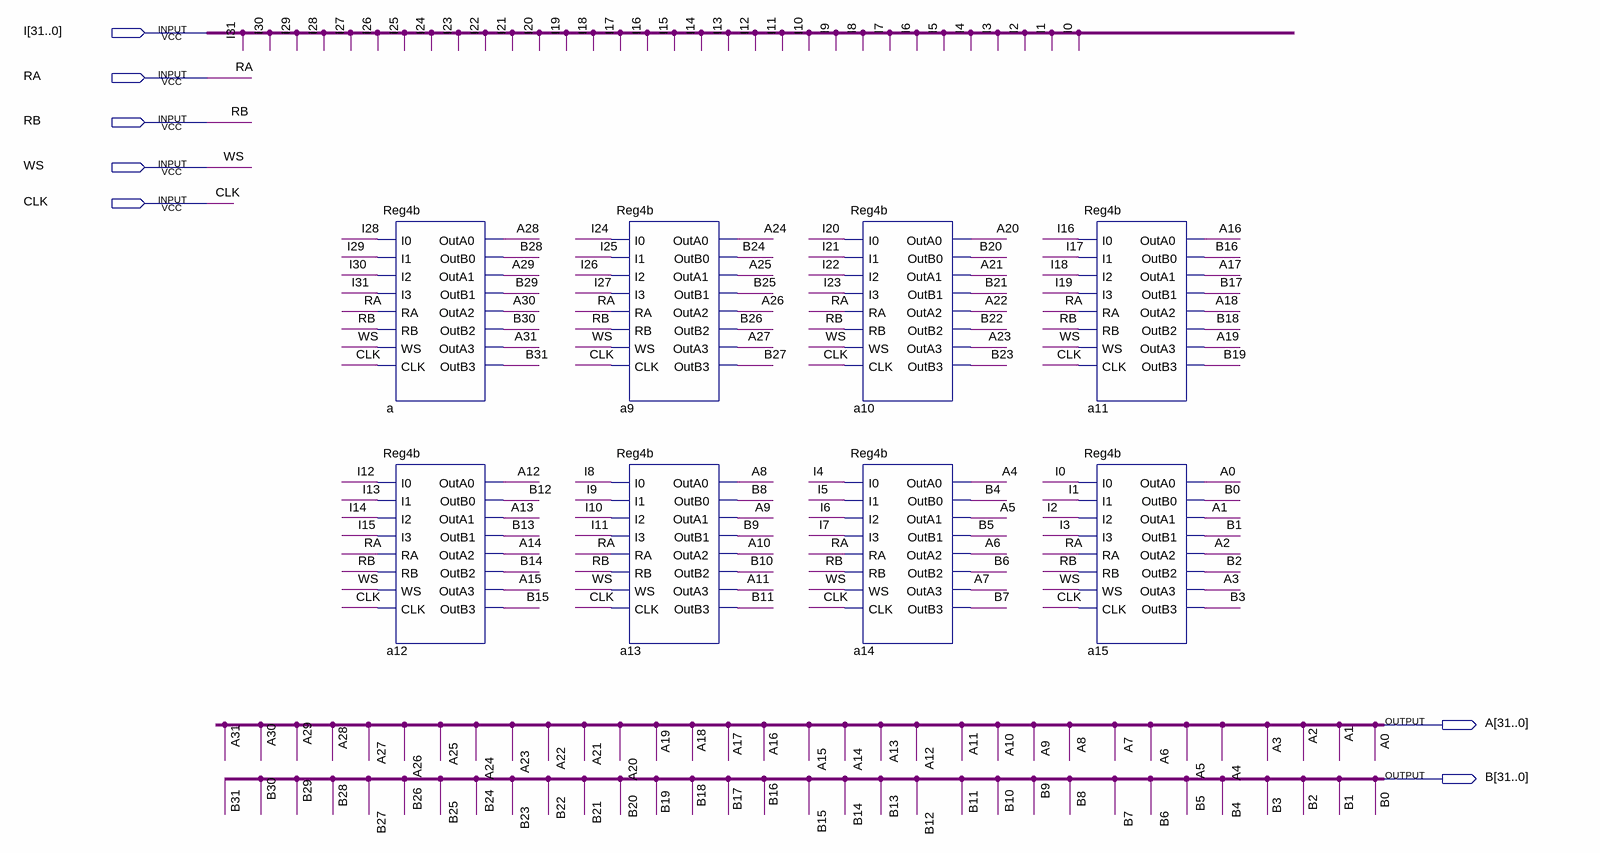
[diagram p0: schematic sheet]
// Quartus schematic R32b.bdf as structural Verilog: 8 symbols, 7 pins
module R32b (
  input  [31:0] I,
  input  RA,
  input  RB,
  input  WS,
  input  CLK,
  output [31:0] A,
  output [31:0] B
);

  Reg4b u_a (
    .I0(I[28]), .I1(I[29]), .I2(I[30]), .I3(I[31]), .RA(RA), .RB(RB), .WS(WS), .CLK(CLK), .OutA0(A[28]),
    .OutB0(B[28]), .OutA1(A[29]), .OutB1(B[29]), .OutA2(A[30]), .OutB2(B[30]), .OutA3(A[31]), .OutB3(B[31]));
  Reg4b a12 (
    .I0(I[12]), .I1(I[13]), .I2(I[14]), .I3(I[15]), .RA(RA), .RB(RB), .WS(WS), .CLK(CLK), .OutA0(A[12]),
    .OutB0(B[12]), .OutA1(A[13]), .OutB1(B[13]), .OutA2(A[14]), .OutB2(B[14]), .OutA3(A[15]), .OutB3(B[15]));
  Reg4b a9 (
    .I0(I[24]), .I1(I[25]), .I2(I[26]), .I3(I[27]), .RA(RA), .RB(RB), .WS(WS), .CLK(CLK), .OutA0(A[24]),
    .OutB0(B[24]), .OutA1(A[25]), .OutB1(B[25]), .OutA2(A[26]), .OutB2(B[26]), .OutA3(A[27]), .OutB3(B[27]));
  Reg4b a13 (
    .I0(I[8]), .I1(I[9]), .I2(I[10]), .I3(I[11]), .RA(RA), .RB(RB), .WS(WS), .CLK(CLK), .OutA0(A[8]),
    .OutB0(B[8]), .OutA1(A[9]), .OutB1(B[9]), .OutA2(A[10]), .OutB2(B[10]), .OutA3(A[11]), .OutB3(B[11]));
  Reg4b a10 (
    .I0(I[20]), .I1(I[21]), .I2(I[22]), .I3(I[23]), .RA(RA), .RB(RB), .WS(WS), .CLK(CLK), .OutA0(A[20]),
    .OutB0(B[20]), .OutA1(A[21]), .OutB1(B[21]), .OutA2(A[22]), .OutB2(B[22]), .OutA3(A[23]), .OutB3(B[23]));
  Reg4b a14 (
    .I0(I[4]), .I1(I[5]), .I2(I[6]), .I3(I[7]), .RA(RA), .RB(RB), .WS(WS), .CLK(CLK), .OutA0(A[4]),
    .OutB0(B[4]), .OutA1(A[5]), .OutB1(B[5]), .OutA2(A[6]), .OutB2(B[6]), .OutA3(A[7]), .OutB3(B[7]));
  Reg4b a11 (
    .I0(I[16]), .I1(I[17]), .I2(I[18]), .I3(I[19]), .RA(RA), .RB(RB), .WS(WS), .CLK(CLK), .OutA0(A[16]),
    .OutB0(B[16]), .OutA1(A[17]), .OutB1(B[17]), .OutA2(A[18]), .OutB2(B[18]), .OutA3(A[19]), .OutB3(B[19]));
  Reg4b a15 (
    .I0(I[0]), .I1(I[1]), .I2(I[2]), .I3(I[3]), .RA(RA), .RB(RB), .WS(WS), .CLK(CLK), .OutA0(A[0]),
    .OutB0(B[0]), .OutA1(A[1]), .OutB1(B[1]), .OutA2(A[2]), .OutB2(B[2]), .OutA3(A[3]), .OutB3(B[3]));
endmodule
